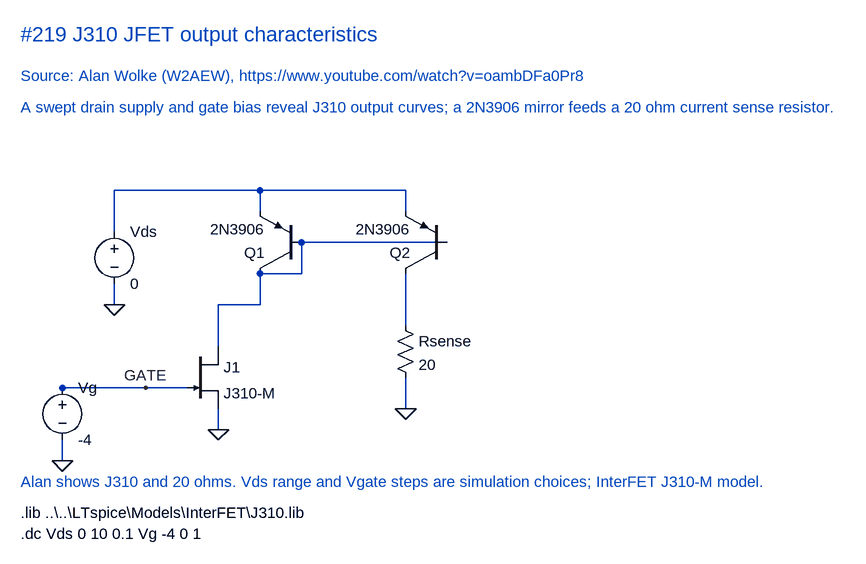
[diagram p0: schematic J310 JFET curve tracer.asc]
J310 JFET curve tracer.asc, the LTspice schematic file:
Version 4.1
SHEET 1 1120 912
WIRE 176 336 176 272
WIRE 400 304 400 272
WIRE 624 304 624 272
WIRE 400 272 176 272
WIRE 624 272 400 272
WIRE 176 416 176 448
WIRE 400 400 400 448
WIRE 464 400 400 400
WIRE 464 400 464 352
WIRE 688 352 464 352
WIRE 624 400 624 480
WIRE 400 448 336 448
WIRE 336 448 336 512
WIRE 624 560 624 608
WIRE 336 608 336 640
WIRE 96 576 288 576
WIRE 96 576 96 576
WIRE 96 656 96 688
FLAG 176 448 0
FLAG 624 608 0
FLAG 336 640 0
FLAG 96 688 0
FLAG 224 576 GATE
SYMBOL voltage 176 320 R0
SYMATTR InstName Vds
SYMATTR Value 0
SYMBOL pnp 464 400 R180
SYMATTR InstName Q1
SYMATTR Value 2N3906
SYMBOL pnp 688 400 R180
SYMATTR InstName Q2
SYMATTR Value 2N3906
SYMBOL res 608 464 R0
SYMATTR InstName Rsense
SYMATTR Value 20
SYMBOL voltage 96 560 R0
SYMATTR InstName Vg
SYMATTR Value -4
SYMBOL njf 288 512 R0
SYMATTR InstName J1
SYMATTR Value J310-M
TEXT 32 32 Left 3 ;#219 J310 JFET output characteristics
TEXT 32 96 Left 2 ;Source: Alan Wolke (W2AEW), https://www.youtube.com/watch?v=oambDFa0Pr8
TEXT 32 144 Left 2 ;A swept drain supply and gate bias reveal J310 output curves; a 2N3906 mirror feeds a 20 ohm current sense resistor.
TEXT 32 720 Left 2 ;Alan shows J310 and 20 ohms. Vds range and Vgate steps are simulation choices; InterFET J310-M model.
TEXT 32 768 Left 2 !.lib ..\..\LTspice\Models\InterFET\J310.lib
TEXT 32 800 Left 2 !.dc Vds 0 10 0.1 Vg -4 0 1

The netlist it stands for:
* J310 JFET curve tracer.asc
Vds N001 0 0
Q1 N002 N002 N001 0 2N3906
Q2 N003 N002 N001 0 2N3906
Rsense N003 0 20
Vg GATE 0 -4
J1 N002 GATE 0 J310-M
.model NPN NPN
.model PNP PNP
.lib standard.bjt
.model NJF NJF
.model PJF PJF
.lib standard.jft
* #219 J310 JFET output characteristics
* Source: Alan Wolke (W2AEW), https://www.youtube.com/watch?v=oambDFa0Pr8
* A swept drain supply and gate bias reveal J310 output curves; a 2N3906 mirror feeds a 20 ohm current sense resistor.
* Alan shows J310 and 20 ohms. Vds range and Vgate steps are simulation choices; InterFET J310-M model.
.lib ..\..\LTspice\Models\InterFET\J310.lib
.dc Vds 0 10 0.1 Vg -4 0 1
.backanno
.end